# Altium schematic sheet 08_test7.SchDoc
size A3
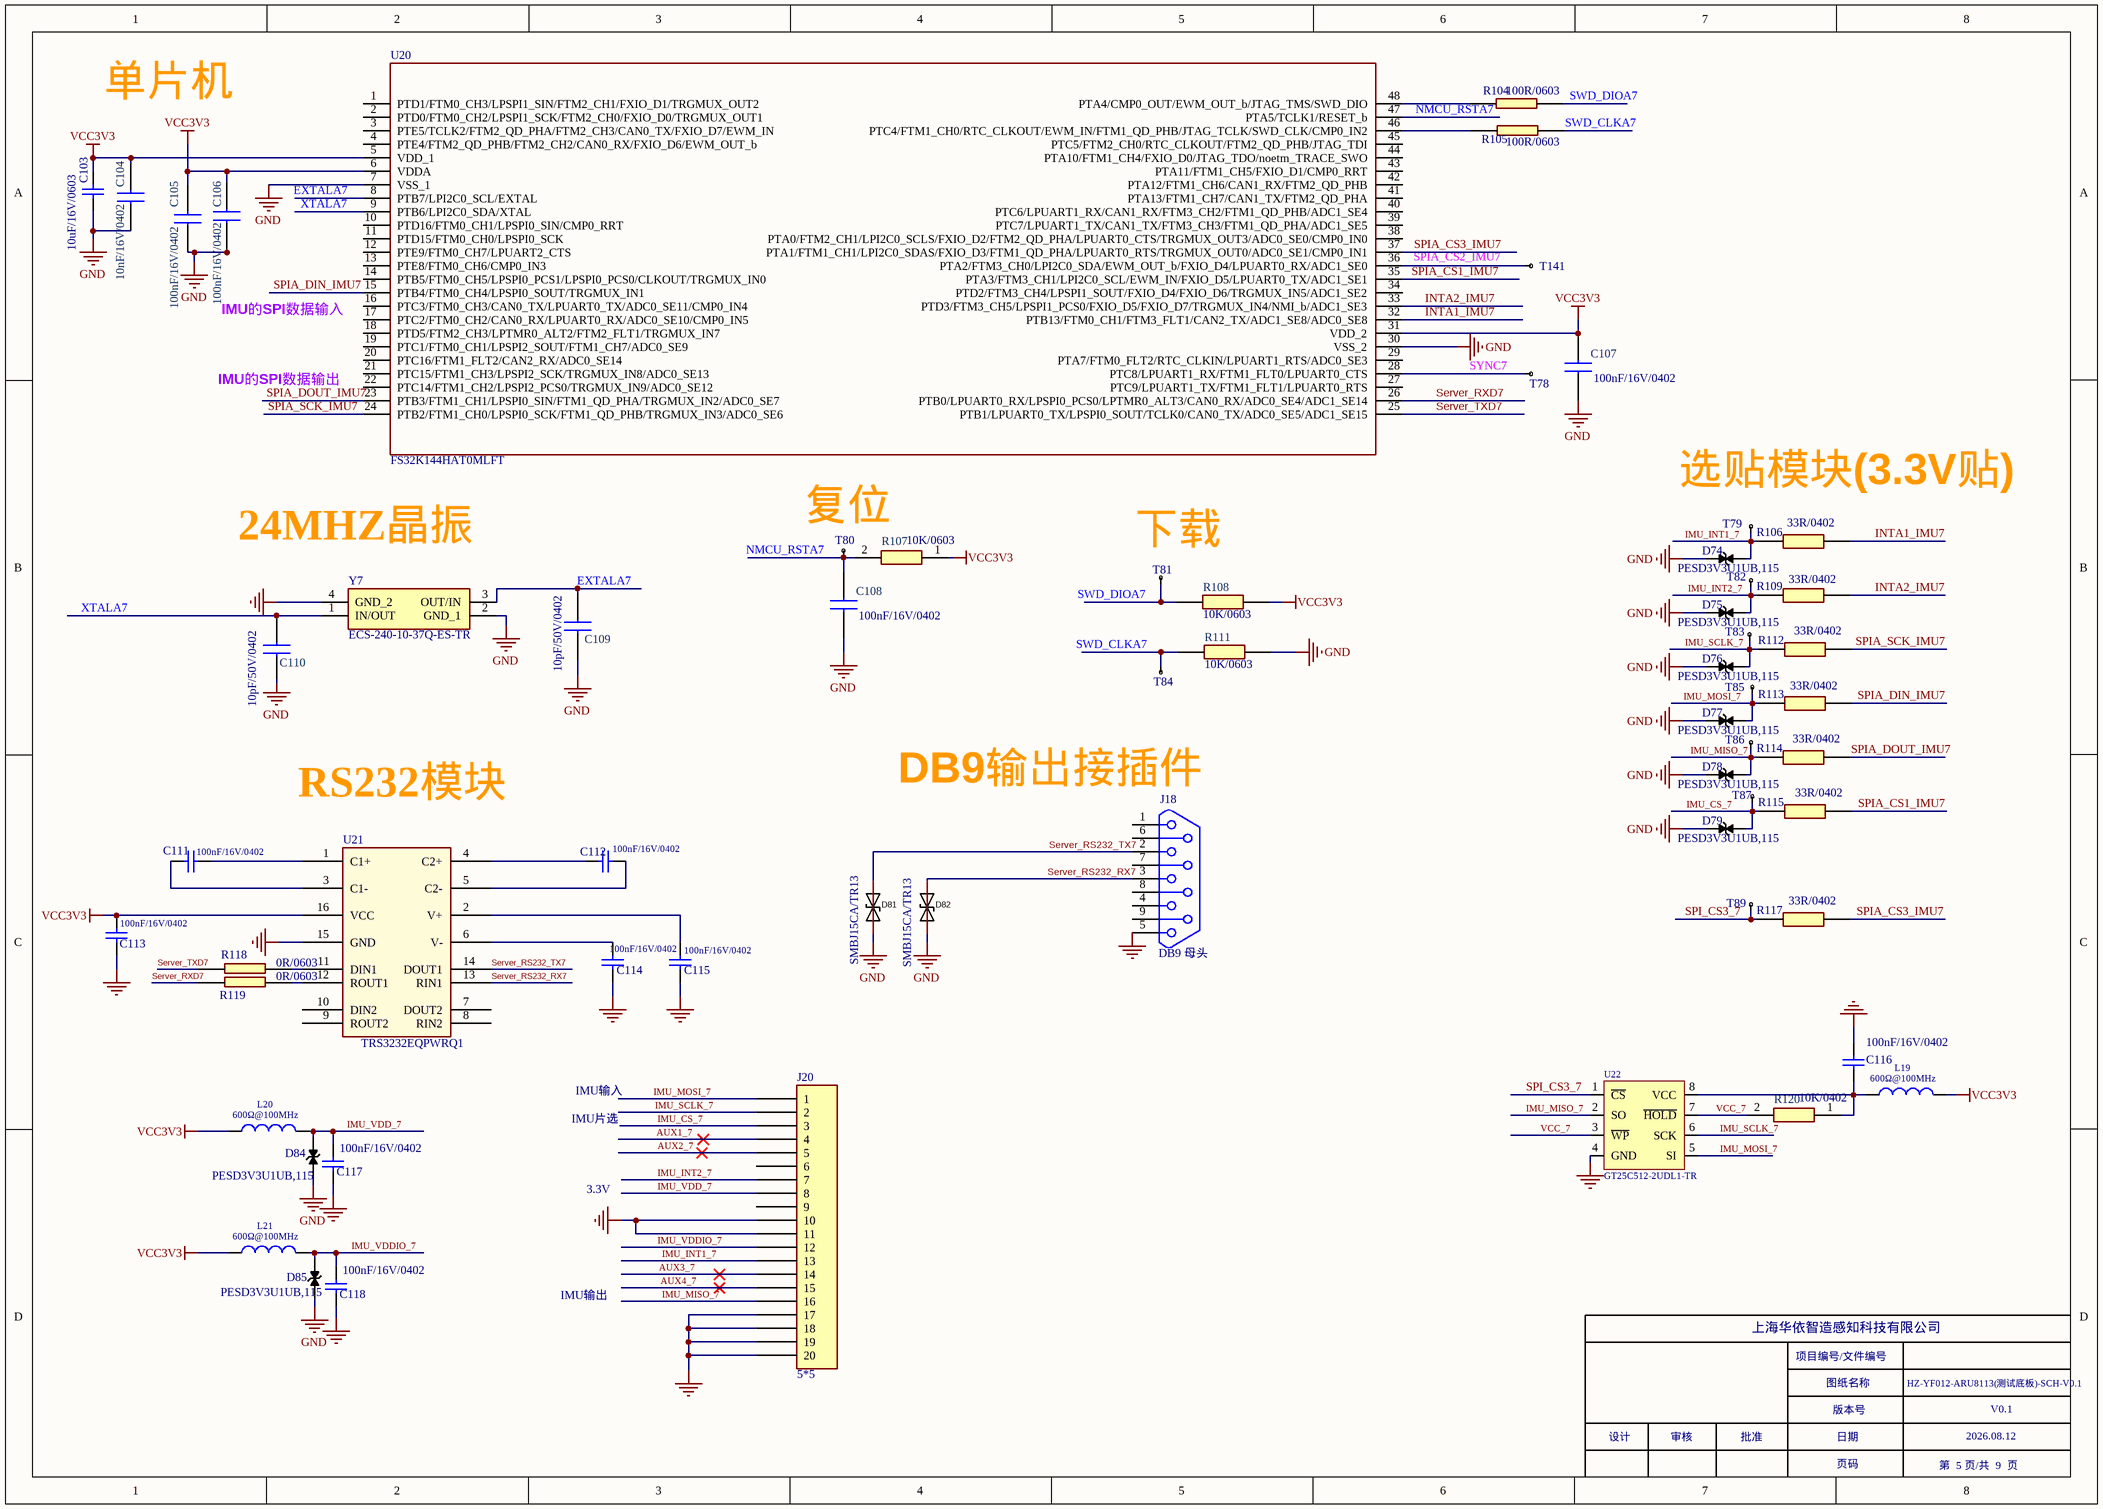
[diagram p0: 08_test7.SchDoc]

## Parts
C103  10uF/16V/0603  [C 0603_L]
C104  10nF/16V/0402  [C 0402_L]
C105  100nF/16V/0402  [C 0402_L]
C106  100nF/16V/0402  [C 0402_L]
C107  100nF/16V/0402  [C 0402_L]
C108  100nF/16V/0402  [C 0402_L]
C109  10pF/50V/0402  [C 0402_L]
C110  10pF/50V/0402  [C 0402_L]
C111  value 100nF/16V/0402  [C 0402_L]  (hidden comment: Cap)
C112  value 100nF/16V/0402  [C 0402_L]  (hidden comment: Cap)
C113  value 100nF/16V/0402  [C 0402_L]  (hidden comment: Cap)
C114  value 100nF/16V/0402  [C 0402_L]  (hidden comment: Cap)
C115  value 100nF/16V/0402  [C 0402_L]  (hidden comment: Cap)
C116  100nF/16V/0402  [0402C]
C117  100nF/16V/0402  [0402C]
C118  100nF/16V/0402  [0402C]
D74  PESD3V3U1UB,115  [SOD-523]
D75  PESD3V3U1UB,115  [SOD-523]
D76  PESD3V3U1UB,115  [SOD-523]
D77  PESD3V3U1UB,115  [SOD-523]
D78  PESD3V3U1UB,115  [SOD-523]
D79  PESD3V3U1UB,115  [SOD-523]
D81  SMBJ15CA/TR13  [SMB]
D82  SMBJ15CA/TR13  [SMB]
D84  PESD3V3U1UB,115  [PESD3V3U1UB,115]
D85  PESD3V3U1UB,115  [PESD3V3U1UB,115]
J18  DB9 母头  [DB9-RS8R1-2R77]
J20  5*5  [5*5-socket]
L19  value 600Ω@100MHz  [0603L]  (hidden comment: Inductor)
L20  value 600Ω@100MHz  [0603L]  (hidden comment: Inductor)
L21  value 600Ω@100MHz  [0603L]  (hidden comment: Inductor)
R104  100R/0603  [R 0603_L]
R105  100R/0603  [R 0603_L]
R106  33R/0402  [0402R]
R107  10K/0603  [R 0603_L]
R108  10K/0603  [R 0603_L]
R109  33R/0402  [0402R]
R111  10K/0603  [R 0603_L]
R112  33R/0402  [0402R]
R113  33R/0402  [0402R]
R114  33R/0402  [0402R]
R115  33R/0402  [0402R]
R117  33R/0402  [0402R]
R118  0R/0603  [R 0603_L]
R119  0R/0603  [R 0603_L]
R120  10K/0402  [0402R]
T78  TEST  [Test-0.5mm]  (value not drawn)
T79  TEST  [TEST]  (value not drawn)
T80  TEST  [TEST]  (value not drawn)
T81  TEST  [TEST]  (value not drawn)
T82  TEST  [TEST]  (value not drawn)
T83  TEST  [TEST]  (value not drawn)
T84  TEST  [TEST]  (value not drawn)
T85  TEST  [TEST]  (value not drawn)
T86  TEST  [TEST]  (value not drawn)
T87  TEST  [TEST]  (value not drawn)
T89  TEST  [TEST]  (value not drawn)
T141  TEST  [Test-0.5mm]  (value not drawn)
U20  FS32K144HAT0MLFT  [LQFP48_7X7]
U21  TRS3232EQPWRQ1  [TSSOP16_640X500]
U22  GT25C512-2UDL1-TR  [GT25C512-2UDLA2-TR]
Y7  ECS-240-10-37Q-ES-TR  [ECS2401037QESTR]

## Nets
GND: C103.2 C104.1 C105.2 C106.2 C107.2 C108.2 C109.1 C110.1 C113.2 C114.2 C115.2 C116.1 C117.2 C118.2 D74.1 D75.1 D76.1 D77.1 D78.1 D79.1 D81.1 D82.1 D84.1 D85.1 J18.5 J20.10 J20.11 J20.17 J20.18 J20.19 J20.20 R111.1 U20.7(VSS_1) U20.30(VSS_2) U21.15(GND) U22.4(GND) Y7.2(GND_1) Y7.4(GND_2)
VCC3V3: C103.1 C104.2 C105.1 C106.1 C107.1 C113.1 L19.2 L20.1 L21.1 R107.1 R108.1 U20.5(VDD_1) U20.6(VDDA) U20.31(VDD_2) U21.16(VCC)
AUX1_7: J20.4
AUX2_7: J20.5
AUX3_7: J20.14
AUX4_7: J20.15
EXTALA7: C109.2 U20.8(PTB7/LPI2C0_SCL/EXTAL) Y7.3(OUT/IN)
IMU_CS_7: D79.2 J20.3 R115.2 T87.1
IMU_INT1_7: D74.2 J20.13 R106.2 T79.1
IMU_INT2_7: D75.2 J20.7 R109.2 T82.1
IMU_MISO_7: D78.2 J20.16 R114.2 T86.1 U22.2(SO)
IMU_MOSI_7: D77.2 J20.1 R113.2 T85.1 U22.5(SI)
IMU_SCLK_7: D76.2 J20.2 R112.2 T83.1 U22.6(SCK)
IMU_VDD_7: C117.1 D84.2 J20.8 L20.2
IMU_VDDIO_7: C118.1 D85.2 J20.12 L21.2
INTA1_IMU7: R106.1 U20.32(PTB13/FTM0_CH1/FTM3_FLT1/CAN2_TX/ADC1_SE8/ADC0_SE8)
INTA2_IMU7: R109.1 U20.33(PTD3/FTM3_CH5/LPSPI1_PCS0/FXIO_D5/FXIO_D7/TRGMUX_IN4/NMI_b/ADC1_SE3)
NMCU_RSTA7: C108.1 R107.2 T80.1 U20.47(PTA5/TCLK1/RESET_b)
Server_RS232_RX7: D82.2 J18.3 U21.13(RIN1)
Server_RS232_TX7: D81.2 J18.2 U21.14(DOUT1)
Server_RXD7: R119.1 U20.26(PTB0/LPUART0_RX/LPSPI0_PCS0/LPTMR0_ALT3/CAN0_RX/ADC0_SE4/ADC1_SE14)
Server_TXD7: R118.1 U20.25(PTB1/LPUART0_TX/LPSPI0_SOUT/TCLK0/CAN0_TX/ADC0_SE5/ADC1_SE15)
SPI_CS3_7: R117.2 T89.1 U22.1(~{CS})
SPIA_CS1_IMU7: R115.1 U20.35(PTA3/FTM3_CH1/LPI2C0_SCL/EWM_IN/FXIO_D5/LPUART0_TX/ADC1_SE1)
SPIA_CS3_IMU7: R117.1 U20.37(PTA1/FTM1_CH1/LPI2C0_SDAS/FXIO_D3/FTM1_QD_PHA/LPUART0_RTS/TRGMUX_OUT0/ADC0_SE1/CMP0_IN1)
SPIA_DIN_IMU7: R113.1 U20.15(PTB4/FTM0_CH4/LPSPI0_SOUT/TRGMUX_IN1)
SPIA_DOUT_IMU7: R114.1 U20.23(PTB3/FTM1_CH1/LPSPI0_SIN/FTM1_QD_PHA/TRGMUX_IN2/ADC0_SE7)
SPIA_SCK_IMU7: R112.1 U20.24(PTB2/FTM1_CH0/LPSPI0_SCK/FTM1_QD_PHB/TRGMUX_IN3/ADC0_SE6)
SWD_CLKA7: R105.2 R111.2 T84.1
SWD_DIOA7: R104.2 R108.2 T81.1
SYNC7: T78.1 U20.28(PTC8/LPUART1_RX/FTM1_FLT0/LPUART0_CTS)
VCC_7: R120.2 U22.3(~{WP}) U22.7(~{HOLD})
XTALA7: C110.2 U20.9(PTB6/LPI2C0_SDA/XTAL) Y7.1(IN/OUT)
NetC111_1: C111.1 U21.3(C1-)
NetC111_2: C111.2 U21.1(C1+)
NetC112_1: C112.1 U21.4(C2+)
NetC112_2: C112.2 U21.5(C2-)
NetC114_1: C114.1 U21.6(V-)
NetC115_1: C115.1 U21.2(V+)
NetC116_2: C116.2 L19.1 R120.1 U22.8(VCC)
NetR104_1: R104.1 U20.48(PTA4/CMP0_OUT/EWM_OUT_b/JTAG_TMS/SWD_DIO)
NetR105_1: R105.1 U20.46(PTC4/FTM1_CH0/RTC_CLKOUT/EWM_IN/FTM1_QD_PHB/JTAG_TCLK/SWD_CLK/CMP0_IN2)
NetR118_2: R118.2 U21.11(DIN1)
NetR119_2: R119.2 U21.12(ROUT1)
NetT141_1: T141.1 U20.36(PTA2/FTM3_CH0/LPI2C0_SDA/EWM_OUT_b/FXIO_D4/LPUART0_RX/ADC1_SE0)

Not connected (* = marked no-connect by the designer): J18 1 4 6 7 8 9; J20 6 9; U20 1(PTD1/FTM0_CH3/LPSPI1_SIN/FTM2_CH1/FXIO_D1/TRGMUX_OUT2) 2(PTD0/FTM0_CH2/LPSPI1_SCK/FTM2_CH0/FXIO_D0/TRGMUX_OUT1) 3(PTE5/TCLK2/FTM2_QD_PHA/FTM2_CH3/CAN0_TX/FXIO_D7/EWM_IN) 4(PTE4/FTM2_QD_PHB/FTM2_CH2/CAN0_RX/FXIO_D6/EWM_OUT_b) 10(PTD16/FTM0_CH1/LPSPI0_SIN/CMP0_RRT) 11(PTD15/FTM0_CH0/LPSPI0_SCK) 12(PTE9/FTM0_CH7/LPUART2_CTS) 13(PTE8/FTM0_CH6/CMP0_IN3) 14(PTB5/FTM0_CH5/LPSPI0_PCS1/LPSPI0_PCS0/CLKOUT/TRGMUX_IN0) 16(PTC3/FTM0_CH3/CAN0_TX/LPUART0_TX/ADC0_SE11/CMP0_IN4) 17(PTC2/FTM0_CH2/CAN0_RX/LPUART0_RX/ADC0_SE10/CMP0_IN5) 18(PTD5/FTM2_CH3/LPTMR0_ALT2/FTM2_FLT1/TRGMUX_IN7) 19(PTC1/FTM0_CH1/LPSPI2_SOUT/FTM1_CH7/ADC0_SE9) 20(PTC16/FTM1_FLT2/CAN2_RX/ADC0_SE14) 21(PTC15/FTM1_CH3/LPSPI2_SCK/TRGMUX_IN8/ADC0_SE13) 22(PTC14/FTM1_CH2/LPSPI2_PCS0/TRGMUX_IN9/ADC0_SE12) 27(PTC9/LPUART1_TX/FTM1_FLT1/LPUART0_RTS) 29(PTA7/FTM0_FLT2/RTC_CLKIN/LPUART1_RTS/ADC0_SE3) 34(PTD2/FTM3_CH4/LPSPI1_SOUT/FXIO_D4/FXIO_D6/TRGMUX_IN5/ADC1_SE2) 38(PTA0/FTM2_CH1/LPI2C0_SCLS/FXIO_D2/FTM2_QD_PHA/LPUART0_CTS/TRGMUX_OUT3/ADC0_SE0/CMP0_IN0) 39(PTC7/LPUART1_TX/CAN1_TX/FTM3_CH3/FTM1_QD_PHA/ADC1_SE5) 40(PTC6/LPUART1_RX/CAN1_RX/FTM3_CH2/FTM1_QD_PHB/ADC1_SE4) 41(PTA13/FTM1_CH7/CAN1_TX/FTM2_QD_PHA) 42(PTA12/FTM1_CH6/CAN1_RX/FTM2_QD_PHB) 43(PTA11/FTM1_CH5/FXIO_D1/CMP0_RRT) 44(PTA10/FTM1_CH4/FXIO_D0/JTAG_TDO/noetm_TRACE_SWO) 45(PTC5/FTM2_CH0/RTC_CLKOUT/FTM2_QD_PHB/JTAG_TDI); U21 7(DOUT2) 8(RIN2) 9(ROUT2) 10(DIN2)

## Notes on the sheet
- 单片机
- IMU的SPI数据输入
- IMU的SPI数据输出
- 选贴模块(3.3V贴)
- (near Y7) 24MHZ晶振
- (near T80) 复位
- (near T81) 下载
- DB9输出接插件
- (near U21) RS232模块
- IMU片选
- IMU输入
- 3.3V
- IMU输出
- 上海华依智造感知科技有限公司
- 项目编号/文件编号
- 图纸名称
- HZ-YF012-ARU8113(测试底板)-SCH-V0.1
- 设计
- 审核
- 批准
- 版本号
- 日期
- 2026.08.12
- V0.1
- 页码
- 第  5 页/共  9  页
- Labels drawn without touching a wire or pin: SPIA_CS2_IMU7

## Library data of the parts
C103 = Cap: SMD/SMT 10UF 16V 20% 0603; Published: 8-Jun-2000; LatestRevisionDate: 17-Jul-2002; LatestRevisionNote: Re-released for DXP Platform.; PackageReference: RAD-0.3; Publisher: Altium Limited; PackageDescription: Radial Cap, Thru-Hole; 2 Leads; 0.3 in Pin Spacing; Value: 10uF/16V
C104-C110 = 0402Capacitor: Capacitor; Manufacturer_Name: Murata Electronics; Manufacturer_Part_Number: GCM155R71C104KA55D; Datasheet Link: https://componentsearchengine.com//GCM155R71C104KA55D.pdf; Height: 0.55mm; Mouser2 Part Number: 81-GCM155R71C104KA5D; Mouser2 Price/Stock: https://www.mouser.com/Search/Refine.aspx?Keyword=81-GCM155R71C104KA5D
C111-C118 = Cap: '100nF/16V/10%/ 0402/X7R / -55℃ ～ 125℃/AEC-Q200; Published: 8-Jun-2000; LatestRevisionDate: 17-Jul-2002; LatestRevisionNote: Re-released for DXP Platform.; PackageReference: RAD-0.3; Publisher: Altium Limited; PackageDescription: Radial Cap, Thru-Hole; 2 Leads; 0.3 in Pin Spacing
  C116-C118: Value: 100nF/16V/0402
D74-D79 D84 D85 = SMBJ36CA: 双向TVS管；600W表面贴装瞬态电压抑制器,工作电压36V，SMB_DO-214AA封装 DIODES
D81 D82 = SMBJ15CA/TR13_C78410: Manufacturer: Brightking(君耀电子); Symbol: SMBJ15CA-C78410; Add into BOM: yes; polarity: 双向; Reverse Stand-Off Voltage (Vrwm): 15V; Maximum Clamping Voltage: 24.4V; Peak Pulse Current (Ipp)@10/1000us: 24.6A; Peak Pulse Power Dissipation (Ppp)@10/1000us: 600W; Breakdown Voltage: 16.7V; Type: TVS; Device: SMBJ15CA/TR13_C78410; LCSC Part Name: 双向 15V截止 24.6A峰值脉冲; Supplier Part: C78410; Manufacturer Part: SMBJ15CA/TR13; Supplier Footprint: SMB(DO-214AA); JLCPCB Part Class: Extended Part; Datasheet: https://atta.szlcsc.com/upload/public/pdf/source/20181127/C309995_EB3DFB9F9AEE5D2146ECD9FA5992A402.pdf; Supplier: LCSC; Convert to PCB: yes
J18 = DB9
L19-L21 = Inductor: Code_IEC: 1005; Published: 8-Jun-2000; LatestRevisionDate: 29-May-2009; LatestRevisionNote: IPC-7351 Footprint Added.; PackageReference: 0402-A; Publisher: Altium Limited; PackageDescription: Chip Inductor; Code_JEITA: 0402
R104 R105 R118 R119 = 0402
R106-R109 R111-R115 R117 R120 = 0402Resistor: Resistor; Manufacturer_Name: KOA Speer; Manufacturer_Part_Number: RN73H1ETTP1002F50; Datasheet Link: https://www.mouser.fr/datasheet/2/219/RN73H-12200.pdf; Height: 0.4mm
U20 = FS32K144HAT0MLFT: Integrated Circuit; Manufacturer_Name: NXP; Datasheet Link: http://www.nxp.com/docs/en/data-sheet/S32K-DS.pdf; Height: 1.6mm; Manufacturer_Part_Number: FS32K144HAT0MLFT
U22 = GT25C512-2UDLA2-TR
Y7 = ECS-240-10-37Q-ES-TR: Crystal or Oscillator; Manufacturer_Name: ECS; Datasheet Link: https://www.ecsxtal.com/store/pdf/ECX-1637Q.pdf; Height: 0.55mm; Manufacturer_Part_Number: ECS-240-10-37Q-ES-TR